# EAGLE design PHMETER_V_1.1.9 (EAGLE 9.6.2)
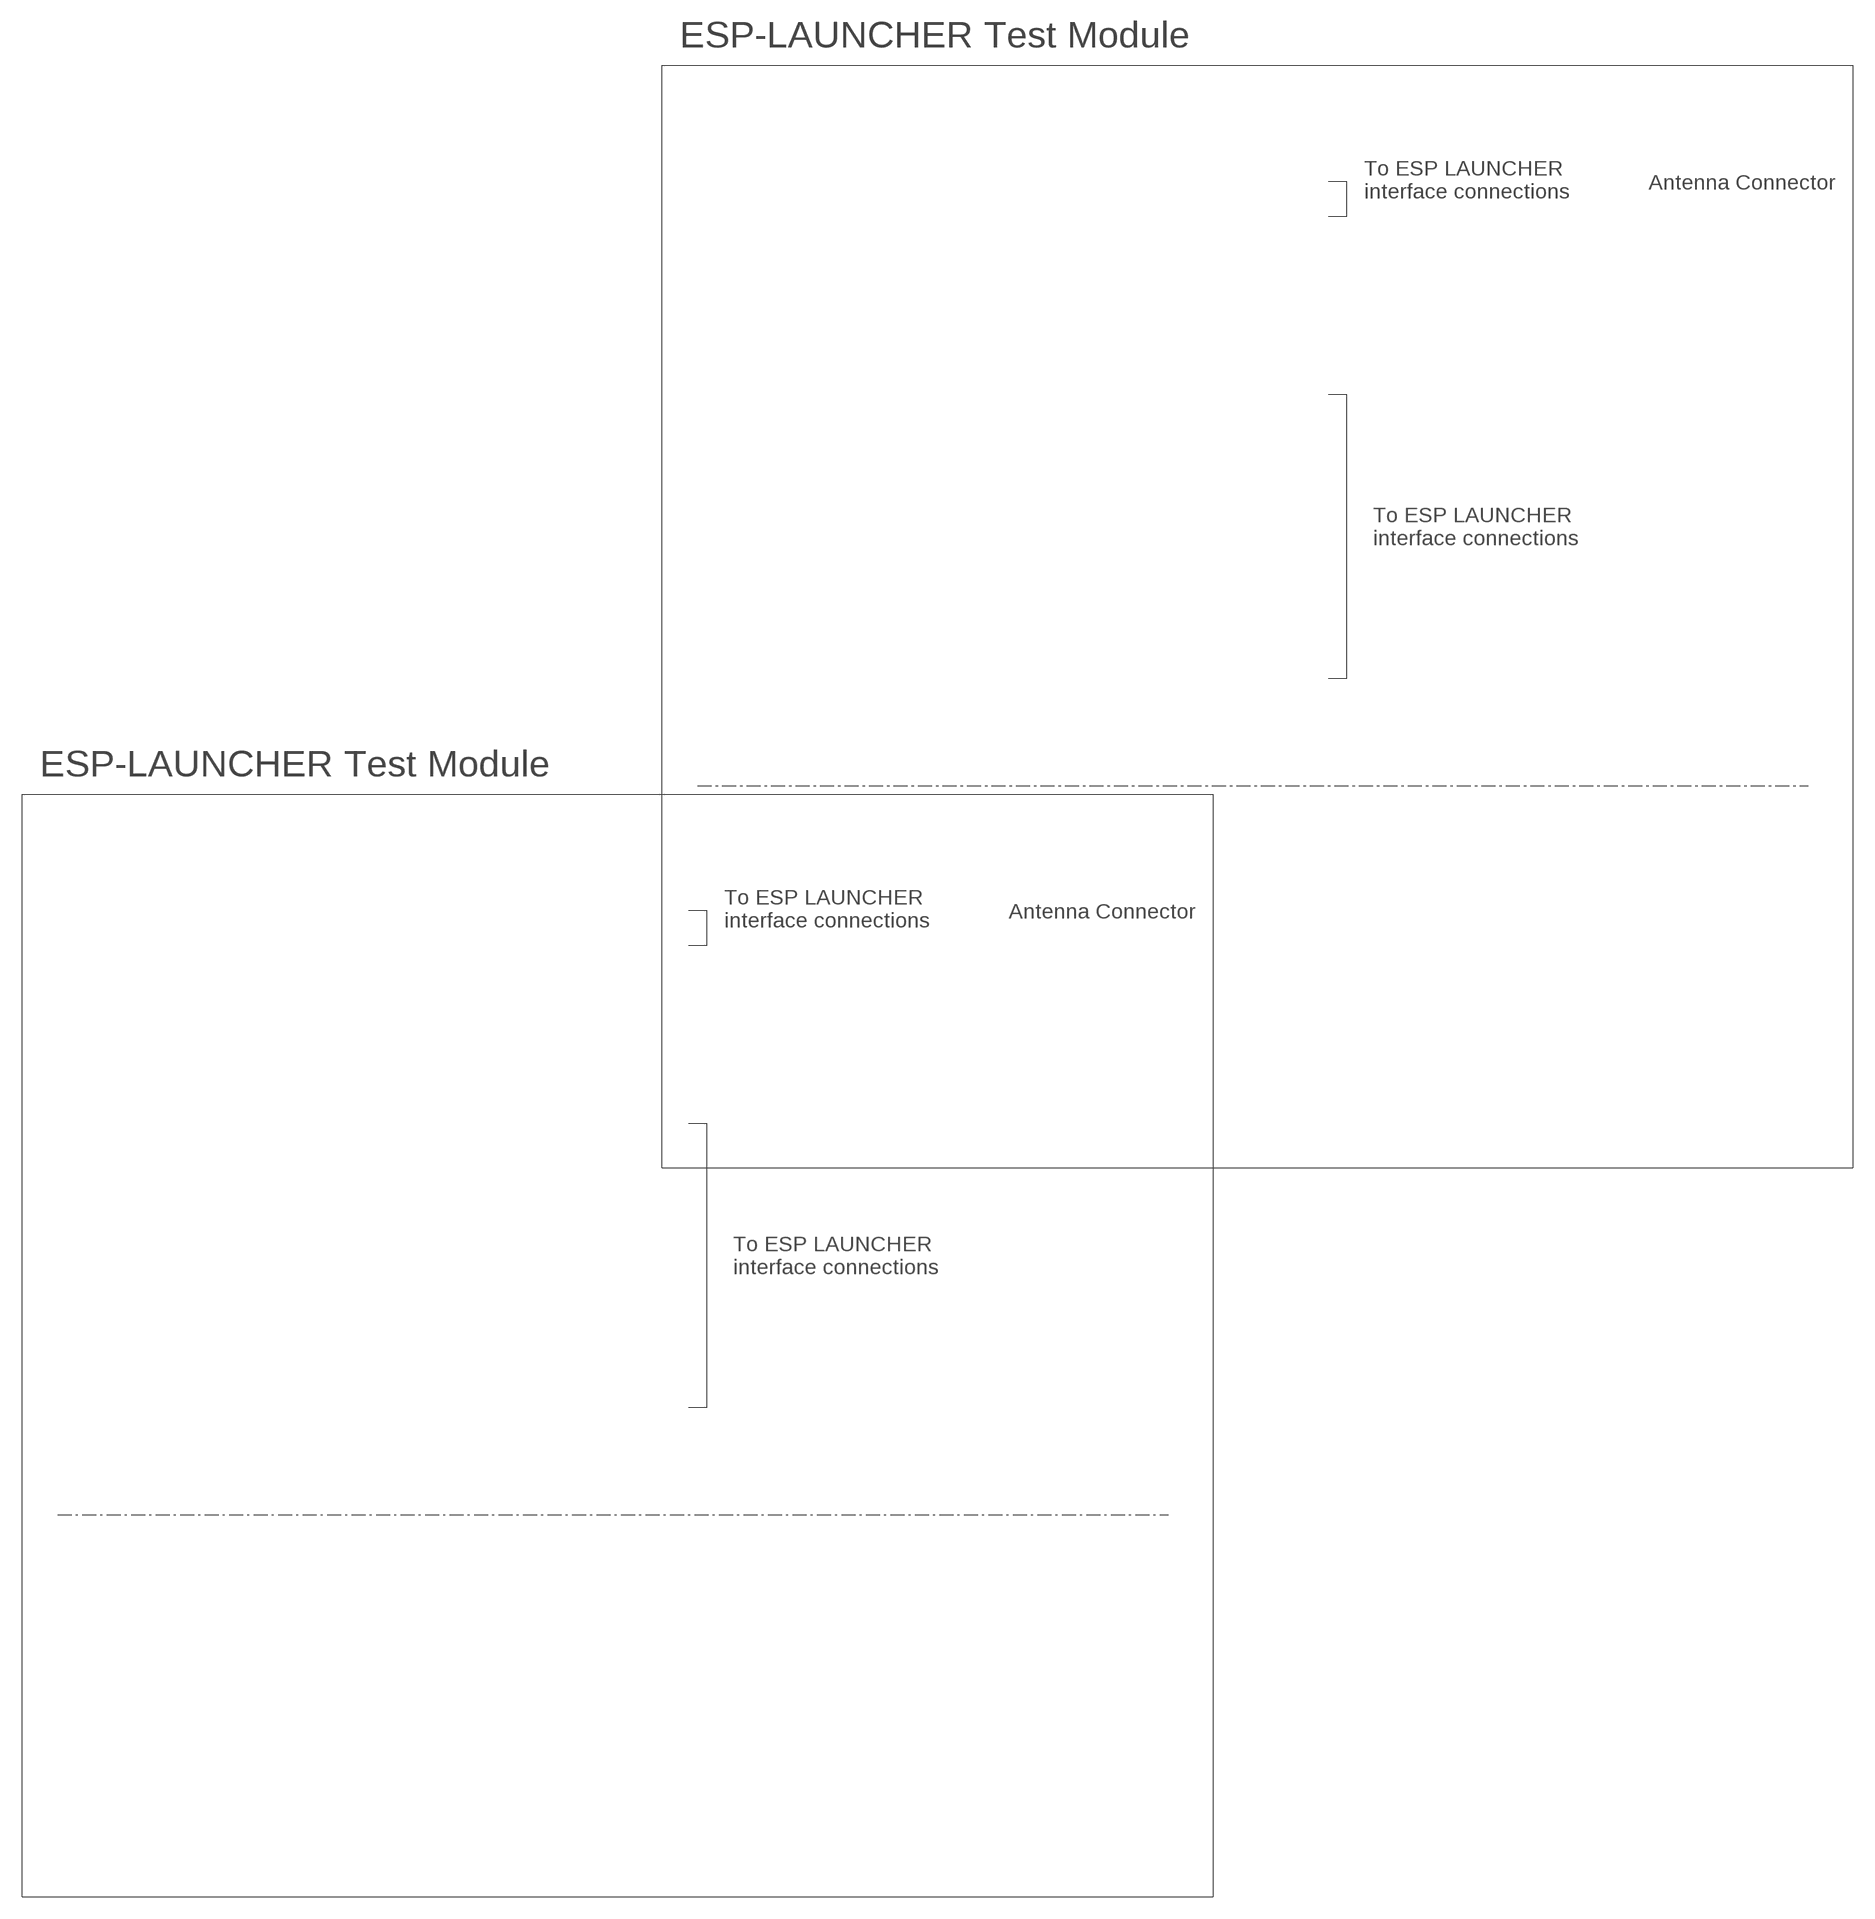
[diagram p0: schematic, sheet 1, part 1 of 3]
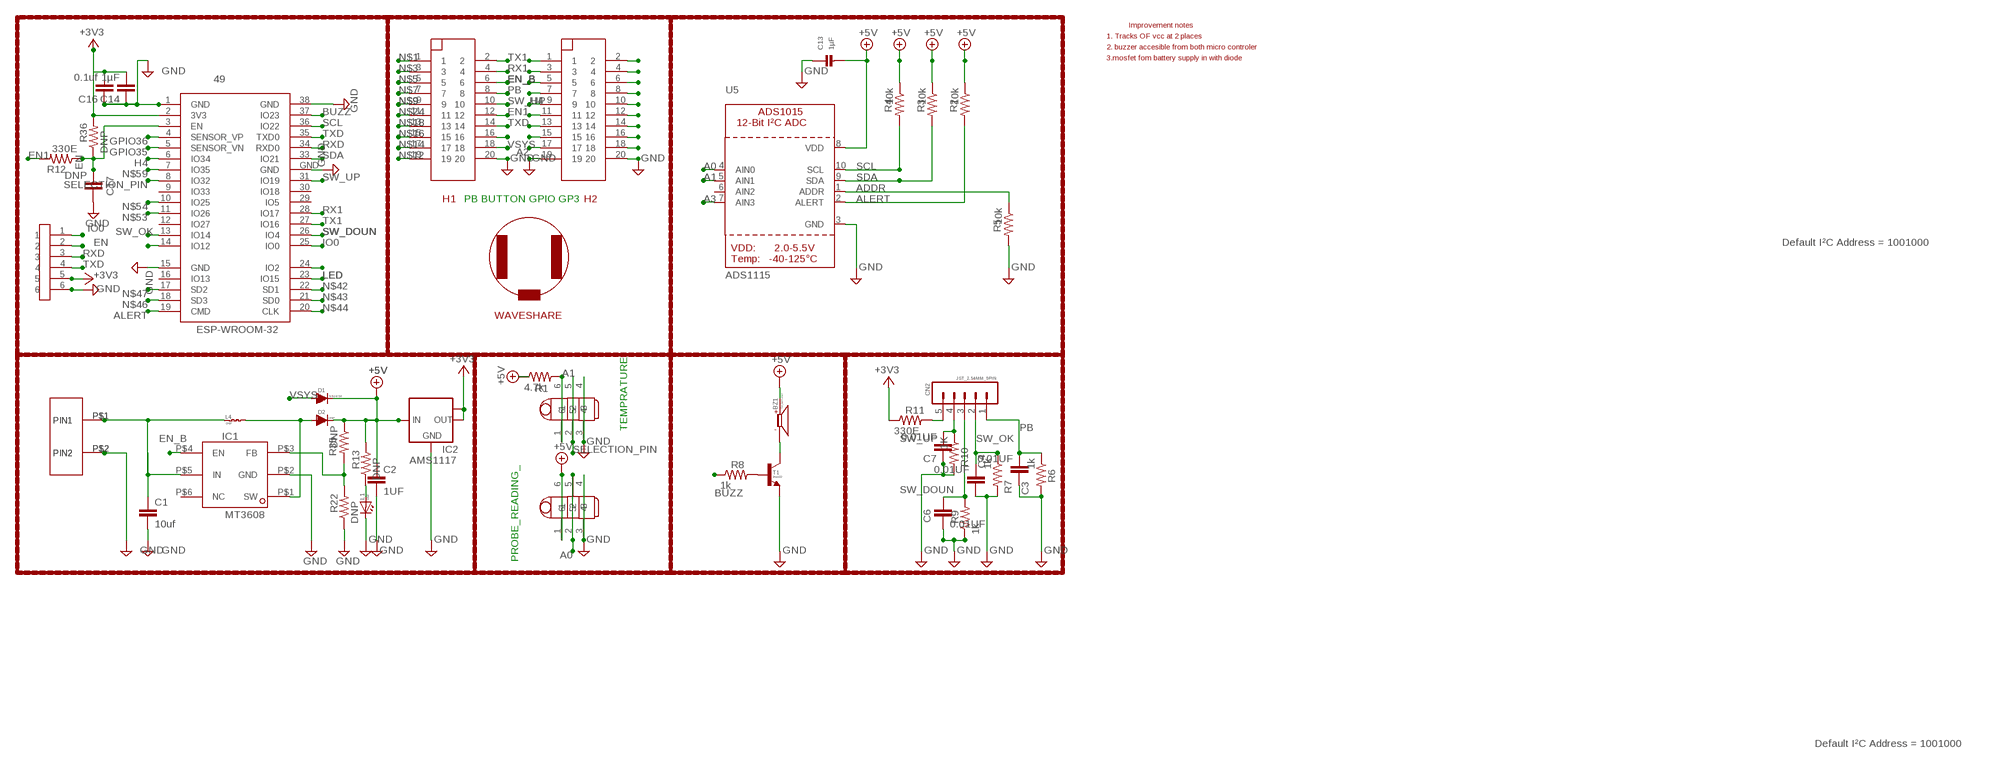
[diagram p1: schematic, sheet 1, part 2 of 3]
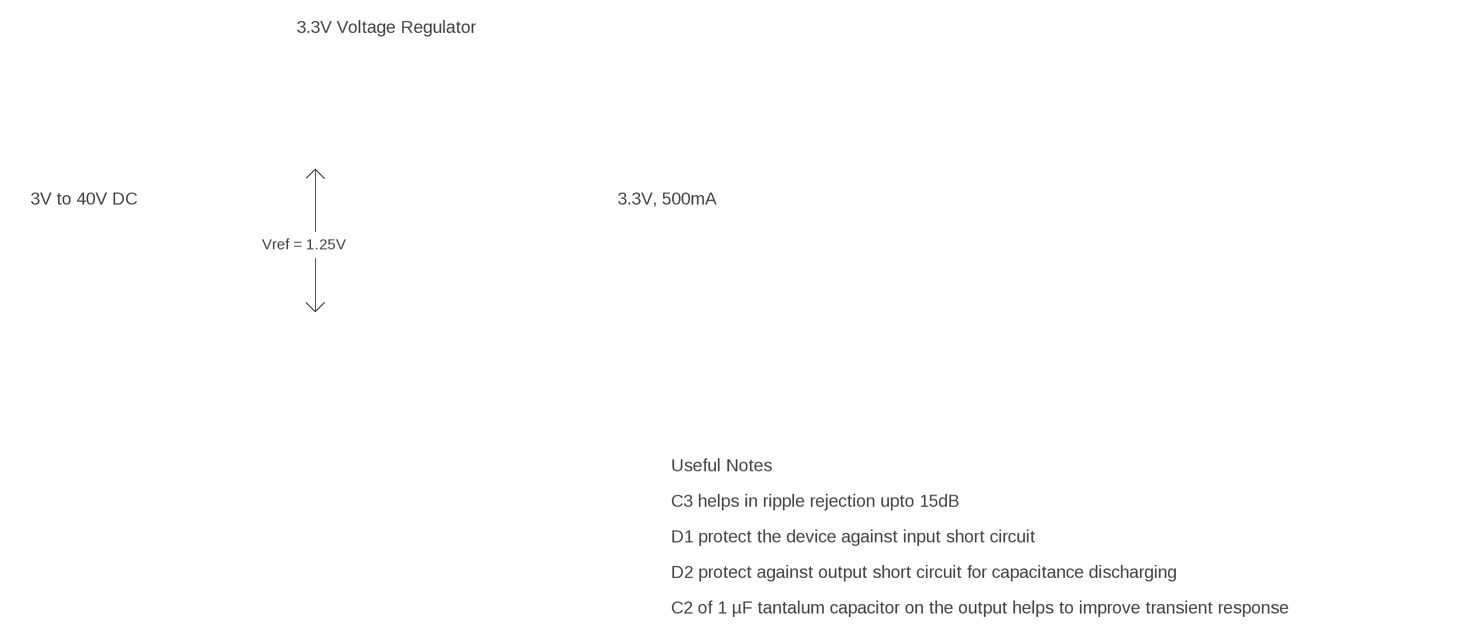
[diagram p2: schematic, sheet 1, part 3 of 3]

## Parts
49  ESP-WROOM-32  [ESP-WROOM-32]
BZ1  5v_buzzer  BUZ  [BUZZ_12MM]
C1  10uf  C-EUC1206K  [C1206K]
C2  1UF  C-EUC1206K  [C1206K]
C3  0.01UF  C-EUC0805K  [C0805K]
C4  0.01UF  C-EUC0805K  [C0805K]
C6  0.01UF  C-EUC0805K  [C0805K]
C7  0.01UF  C-EUC0805K  [C0805K]
C13  1µF  CAP_CERAMIC0805  [0805]
C14  1µF  C-EUC0805K  [C0805K]
C16  0.1uf  C-EUC0805K  [C0805K]
C17  DNP  C-EUC0805K  [C0805K]
CN2  JST_2.54MM_5PIN  JST_5-PIN  [JST_5-PIN]
D1  SS14//34  DIODE  [SMB]
D2  DNP  DIODE  [SMB]
IC1  MT3608SOT23-6  [SOT23-6]
IC2  AMS1117  LM1117MPX-5.0  [SOT223]
L1  DNP  LED  [SMB_L]
L4  DNP  INDUCTOR  [DR-75]
R1  4.7k  R-US_M0805  [M0805]
R2  10k  R-US_M0805  [M0805]
R3  10k  R-US_M0805  [M0805]
R4  10k  R-US_R1206  [R1206]
R5  10k  R-US_M0805  [M0805]
R6  1k  R-US_M0805  [M0805]
R7  1k  R-US_M0805  [M0805]
R8  1k  R-US_M0805  [M0805]
R9  1k  R-US_M0805  [M0805]
R10  1K  R-US_M0805  [M0805]
R11  330E  R-US_M0805  [M0805]
R12  330E  R-US_M0805  [M0805]
R13  DNP  R-US_M0805  [M0805]
R22  DNP  R-US_M0805  [M0805]
R35  DNP  R-US_R1206  [R1206]
R36  DNP  R-US_M0805  [M0805]
T1  2N2222  TRANSISTOR_NPNSOT-23  [SOT-23]
U5  ADS1115  ADC_ADS1015  [MSOP10]
U$2  1.27_6PIN  [1.27_6PIN]
U$3  1.27MM102SMD  [1.27MM10*2SMD]
U$4  1.27MM102SMD  [1.27MM10*2SMD]
U$5  1.27MM2PIN1.27MM  [1.27MM_2PIN]
U$31  AUX_FEMALE_THT  [AUX_FEMALE_THT]
U$32  AUX_FEMALE_THT  [AUX_FEMALE_THT]
U$35  1.27MM2PIN1.27MM  [1.27MM_2PIN]
WAVESHARE1  DISPLAY  WAVESHARE1  [WAVESHARE]

## Nets
+3V3: 49.2(3V3) C14.2 C16.2 IC2.2(OUT) IC2.TAB(OUT1) R11.1 R36.2 U$2.5
+5V: BZ1.+ C2.1 C13.2 D1.K D2.K IC2.3(IN) R1.1 R2.1 R3.1 R4.1 R13.2 R35.1 U5.8(VDD) U$32.1 U$32.6
A0: U5.4(AIN0) U$32.2 U$32.5
A1: R1.2 U5.5(AIN1) U$31.1 U$31.6
A2: U$4.17
A3: U5.7(AIN3)
ADDR: R5.1 U5.1(ADDR)
ALERT: 49.19(CMD) R2.2 U5.2(ALERT)
BUZZ: 49.37(IO23) R8.1
EN: 49.3(EN) C17.2 R12.1 R36.1 U$2.2
EN1: R12.2 U$3.12
EN_B: IC1.P$4(EN) U$3.6
GND: 49.1(GND) 49.15(GND) 49.38(GND) 49.GND C1.2 C2.2 C3.1 C4.1 C6.2 C7.1 C13.1 C14.1 C16.1 C17.1 IC1.P$2(GND) IC2.1(GND) L1.K R5.2 R6.2 R7.2 R9.1 R10.2 R22.1 T1.2(E) U5.3(GND) U$2.6 U$3.20 U$4.19 U$4.20 U$5.P$2(PIN2) U$31.3 U$31.4 U$32.3 U$32.4 U$35.P$2(PIN2)
GPIO35: 49.5(SENSOR_VN)
GPIO36: 49.4(SENSOR_VP)
H4: 49.6(IO34) U$4.9
IO0: 49.25(IO0) U$2.1
LED: 49.23(IO15)
N$1: U$3.1
N$3: U$3.3
N$4: CN2.5 R11.2
N$5: U$3.5
N$6: 49.24(IO2)
N$7: U$3.7
N$8: L1.A R13.1
N$9: U$3.9
N$11: 49.14(IO12)
N$12: U$3.19
N$13: U$4.14
N$14: U$3.17
N$15: U$3.16
N$16: U$3.15
N$18: U$3.13
N$22: IC1.P$3(FB) R22.2 R35.2
N$23: C1.1 IC1.P$5(IN) L4.1 U$5.P$1(PIN1) U$35.P$1(PIN1)
N$24: U$3.11
N$25: U$4.1
N$26: D2.A IC1.P$1(SW) L4.2
N$27: U$4.2
N$28: U$4.3
N$29: U$4.4
N$30: U$4.5
N$35: U$4.6
N$37: R8.2 T1.1(B)
N$38: BZ1.- T1.3(C)
N$39: U$4.7
N$40: U$4.8
N$42: 49.22(SD1)
N$43: 49.21(SD0)
N$44: 49.20(CLK)
N$46: 49.18(SD3)
N$47: 49.17(SD2)
N$53: 49.11(IO26)
N$54: 49.10(IO25)
N$59: 49.7(IO35)
N$60: U$4.10
N$63: U$4.18
N$65: U$4.16
N$66: U$4.15
N$68: U$4.13
N$69: U$4.12
N$70: U$4.11
PB: C3.2 CN2.1 R6.1 U$3.8
RX1: 49.28(IO17) U$3.4
RXD: 49.34(RXD0) U$2.3
SCL: 49.36(IO22) R4.2 U5.10(SCL)
SDA: 49.33(IO21) R3.2 U5.9(SDA)
SELECTION_PIN: 49.8(IO32) U$31.2 U$31.5
SW_DOUN: 49.26(IO4) C6.1 CN2.3 R9.2
SW_OK: 49.13(IO14) C4.2 CN2.2 R7.1
SW_UP: 49.31(IO19) C7.2 CN2.4 R10.1 U$3.10
TX1: 49.27(IO16) U$3.2
TXD: 49.35(TXD0) U$2.4 U$3.14
VSYS: D1.A U$3.18
Unconnected: 49.9(IO33) 49.12(IO27) 49.16(IO13) 49.29(IO5) 49.30(IO18) IC1.P$6(NC) U5.6(AIN2)

## Notes on the sheet
- ESP-LAUNCHER Test Module
- Antenna Connector
- To ESP LAUNCHER
  interface connections
- To ESP LAUNCHER
  interface connections
- ESP-LAUNCHER Test Module
- Antenna Connector
- To ESP LAUNCHER
  interface connections
- To ESP LAUNCHER
  interface connections
- Improvement notes
- 1. Tracks OF vcc at 2 places
- 2. buzzer accesible from both micro controler
- 3.mosfet fom battery supply in with diode
- H1 | PB BUTTON GPIO GP3 | H2
- Default I²C Address = 1001000
- TEMPRATURE
- PROBE_READING_
- Default I²C Address = 1001000
- 3.3V Voltage Regulator
- 3V to 40V DC | 3.3V, 500mA
- Vref = 1.25V
- Useful Notes
- C3 helps in ripple rejection upto 15dB
- D1 protect the device against input short circuit
- D2 protect against output short circuit for capacitance discharging
- C2 of 1 µF tantalum capacitor on the output helps to improve transient response

## Library data of the parts
49 = esp32:ESP-WROOM-32: Espressif Systems ESP-WROOM-32
BZ1 = Squadron:BUZ
C1-C4 C6 C7 C14 C16 C17 = rcl:C-EU: CAPACITOR, European symbol; SPICEPREFIX: C
C13 = microbuilder:CAP_CERAMIC: Ceramic Capacitors 0402 - 0402 Surface Mount Capacitors 16pF 50V 5% [Digikey: 445-4899-2-ND] 18pF 50V 5% [Digikey: 490-1281-2-ND] 22pF 50V 5% [Digikey: 490-1283-2-ND] 68pF 50V 5% [Digikey: 490-1289-2-ND] 0.1uF 10V 10% [Digikey: 490-1318-2-ND] 1.0uF 6.3V 10% [Digikey: 490-1320-2-ND] 0603 - 0603 Surface Mount Capacitors 16 pF 50V 5% [Digikey: 445-5051-2-ND] 22 pF 50V [Digikey: PCC220ACVTR-ND] 33 pF 50V 5% [Digikey: 490-1415-1-ND] 56pF 50V 5% [Digikey: 490-1421-1-ND] 220pF 50V 5% [Digikey: 445-1285-1-ND] 680 pF 50V 2200 pF 50V 5% C0G [Digikey: 445-1297-1-ND] 5600 pF 100V 5% X7R [Digikey: 478-3711-1-ND] 0.1 µF 25V 10% [Digikey: PCC2277TR-ND] 0.22 µF 16V 10% X7R [Digikey: 445-1318-1-ND] 1.0 µF 25V 10% [Digikey: 445-5146-2-ND] 0603 - RF Specific 3pF 250V +/-0.1pF RF [Digikey: 712-1347-1-ND] 18 pF 250V 5% [Digikey: 478-3505-1-ND or 712-1322-1-ND] 56 pF 250V 5% C0G RF [Digikey: 490-4867-1-ND] 68 pF 250V RF [Digikey: 490-4868-1-ND] 0805 - 0805 Surface Mount Capacitors 220 pF 250V 2% RF Ceramic Capacitor [Digikey: 712-1398-1-ND] 1000 pF 50V 2% NP0 Ceramic Capacitor [Digikey: 478-3760-1-ND] 0.1 µF 25V 10% Ceramic Capacitor [Digikey: PCC1828TR-ND] 1.0 µF 16V 10% Ceramic Capacitor[Digikey: 490-1691-2-ND] 10.0 µF 10V 10% Ceramic Capacitor[Digikey: 709-1228-1-ND] 10.0 uF 16V 10% Ceramic Capacitor [Digikey: 478-5165-2-ND] 47 uF 6.3V 20% Ceramic Capacitor [Digikey: 587-1779-1-ND or 399-5506-1-ND] 1206 - 1206 Surface Mount Capacitors 47uF 10V 20% Ceramic Capacitor [Digikey: 490-5528-1-ND or 399-5508-1-ND or 445-6010-1-ND] 100uF 6.3V -20%, +80% Y5V Ceramic Capacitor (Digikey: 490-4512-1-ND, Mouser: 81-GRM31CF50J107ZE1L)
CN2 = Squadron:JST_5-PIN
D1 D2 = Squadron:DIODE
IC1 = MT3608:MT3608: MT3608 High Efficiency 1.2MHz 2A Step Up Converter BY: Rangana Tennakoon
IC2 = lm1117:LM1117MPX-*
L1 = Squadron:LED
L4 = Squadron:INDUCTOR
R1-R13 R22 R35 R36 = rcl:R-US_: RESISTOR, American symbol; SPICEPREFIX: R
T1 = Squadron:TRANSISTOR_NPN
U5 = microbuilder:ADC_ADS1015: ADS1015 - 12-bit 4-Channel I2C ADC with Internal PGA VDD: 2.0-5.5V Sampling Rate: 3.3ksps Gain Settings: 2/3, 1, 2, 4, 8, 16 I2C Address: ADDR low = 1001000x, ADDR high = 1001001x Internal Comparator The ADS1015 includes an internal comparator that can be set to output a high-level on ALERT when the conversion results exceeeds a pre-defined upper level, and will deassert itself when the level falls below a pre-defined lower threshold level. It can also be set to windowed mode where the ALERT pin will be asserted if the data exceeds the upper threshold or falls below the lower threshold.
U$2 = 1.27mm connector:1.27_6PIN
U$3 U$4 = 1.27mm connector:1.27MM10*2SMD
U$5 U$35 = 1.27mm connector:1.27MM2PIN
U$31 U$32 = aux female:AUX_FEMALE_THT
WAVESHARE1 = waveshare:WAVESHARE

## Module WAVESHAREDISPLAY
Ports: 

### Library data of the parts

## Board
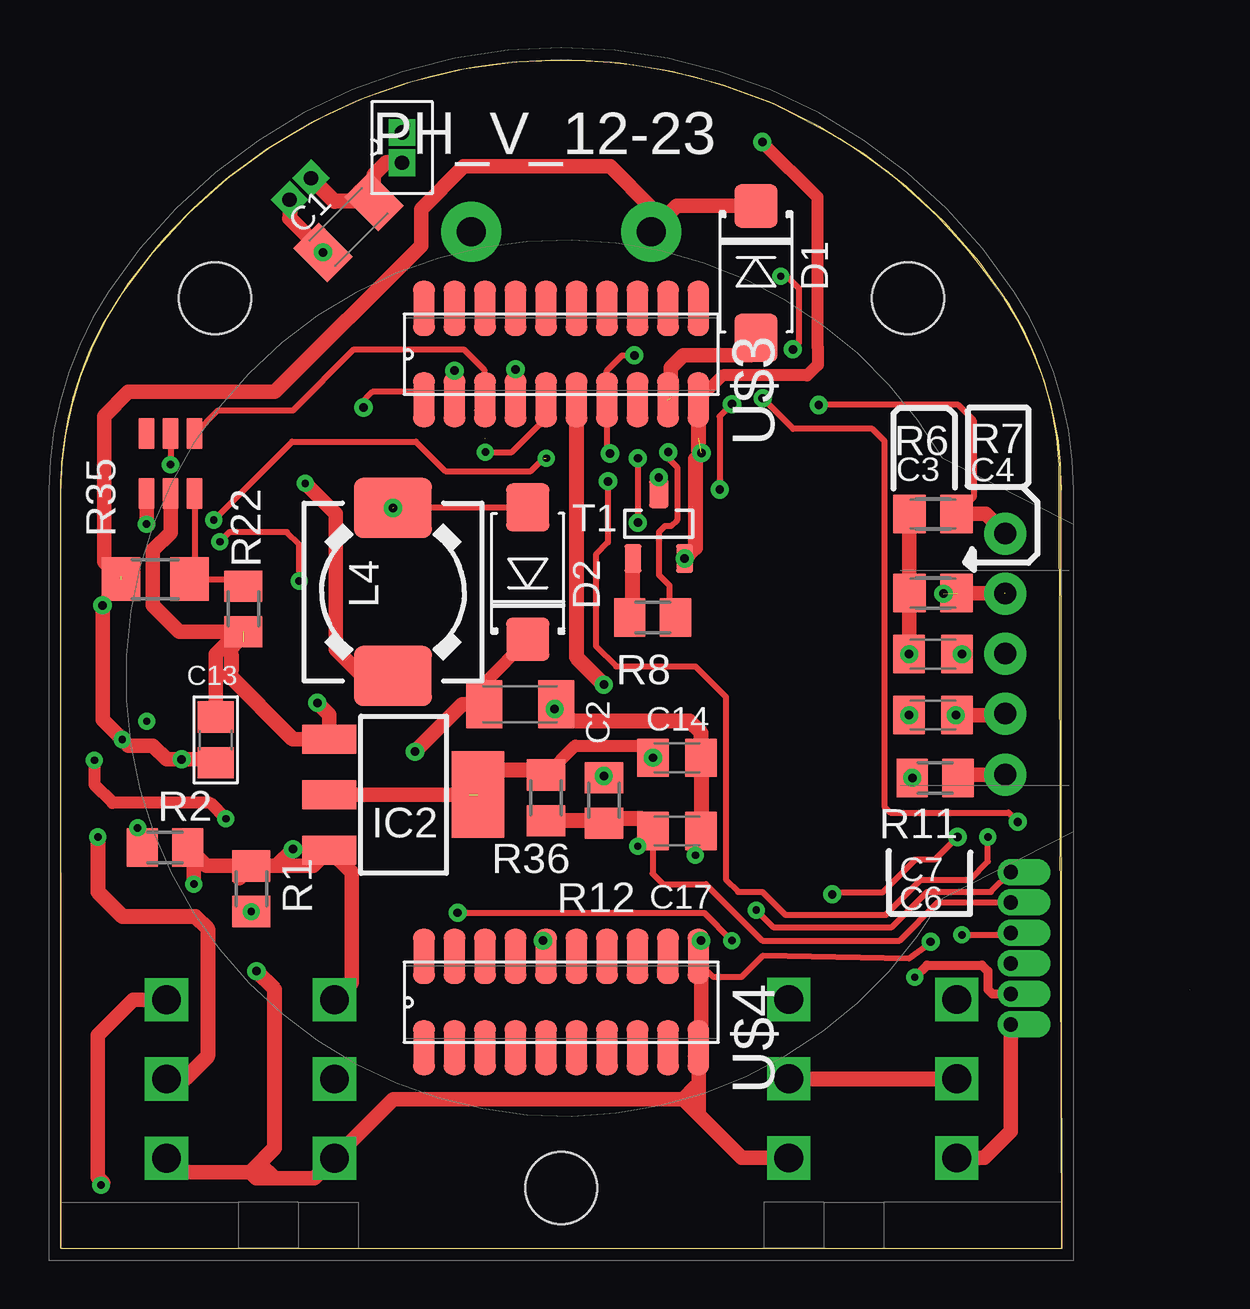
[diagram p3: board, top side]
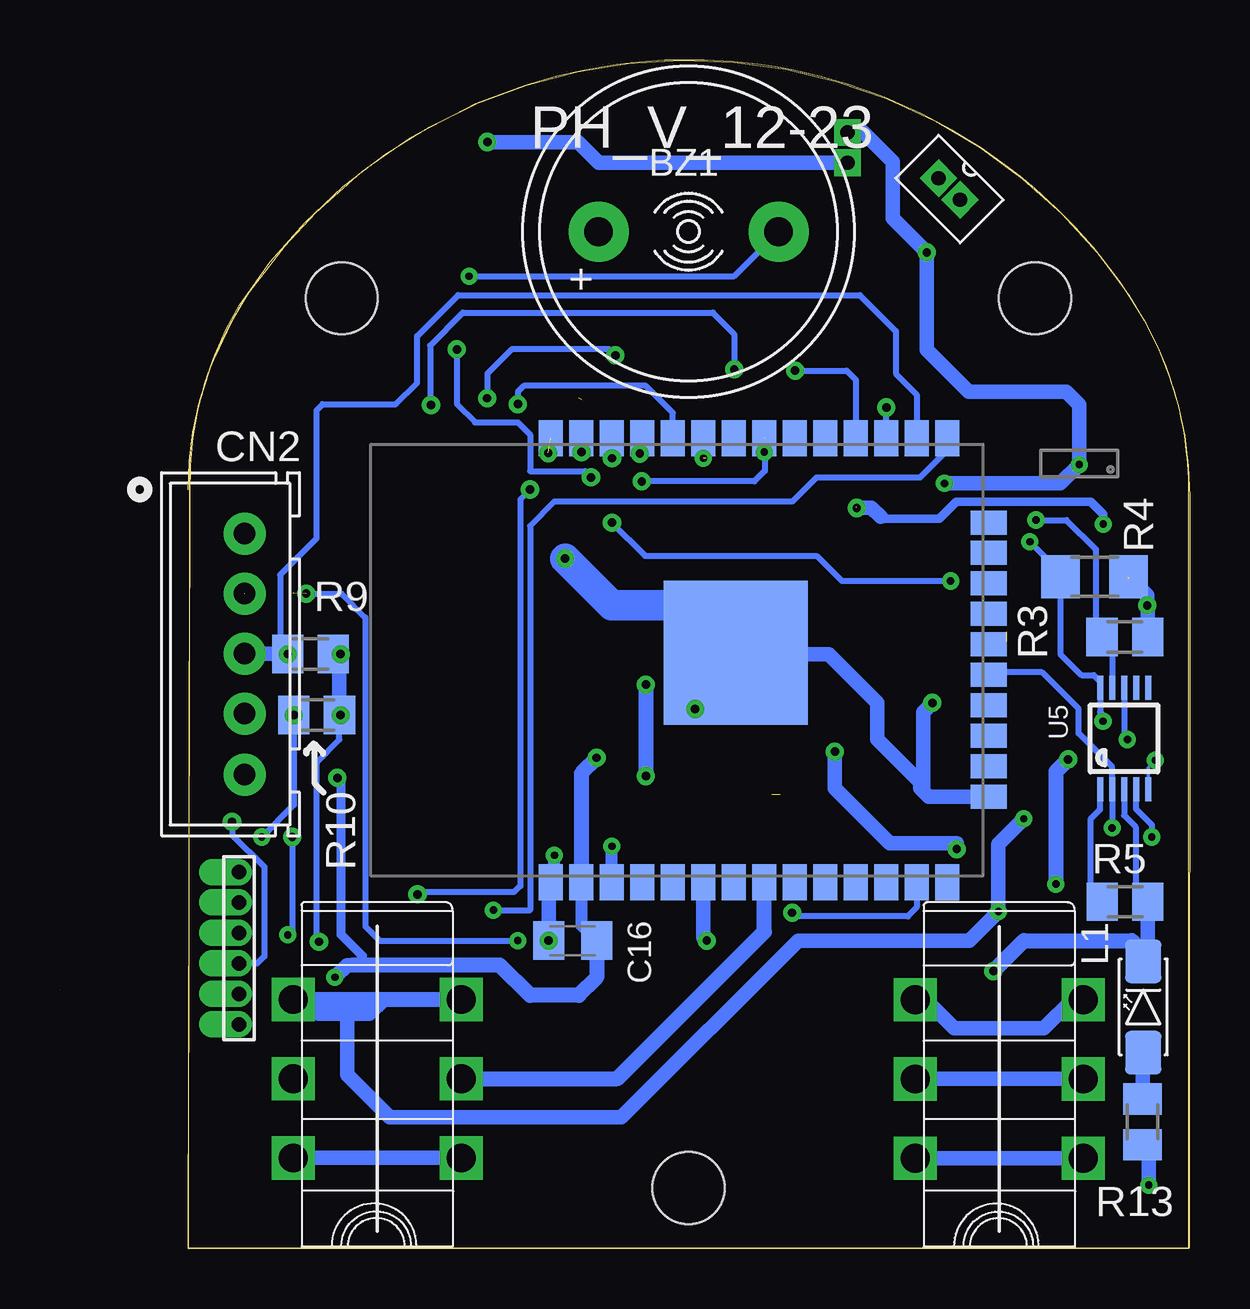
[diagram p4: board, bottom side, seen from below]

Size 47.07 x 49.52 mm. Coordinates in mm from the lower left corner, seen from the top.
Outline: 39.21,39.83 39.64,39.13 39.96,38.56 40.61,37.18
Outline: 41.73,31.61 arc33 39.35,39.58
Outline: 41.73,31.61 arc33 39.35,39.58
Outline: 41.73,31.61 arc33 39.35,39.58
Outline: 41.73,31.61 arc33 39.35,39.58
Outline: 41.73,0 41.64,31.45 arc33 39.58,39.33 arc113 2.54,39.75 arc33 0,31.33 0.03,0.01 41.73,0
Outline: 47.07,10.78 47.07,10.78
Copper layers (1*16): Top 0.035mm / dielectric 1.5mm / Bottom 0.035mm
Design rules "default": minimum track width 6mil, minimum drill 0.35mm, track to track 6mil, track to pad 6mil, pad to pad 6mil, via to via 6mil, smd to smd 6mil, copper to edge 40mil, drill to drill 6mil, minimum pad ring 10mil, minimum via ring 8mil, stop-mask expansion 4mil, vias tented up to drill 0mil, thermal gap 10mil
Holes 3 mm at 20.89,2.52 6.46,39.6 35.34,39.6
tRestrict: area 17.9,-0.5 to 23.8,5.4; area 3.4,36.7 to 9.5,42.8; area 32.3,36.4 to 38.5,42.6
bRestrict: area 17.8,-0.6 to 23.9,5.5; area 3.4,36.8 to 9.4,42.7; area 32.3,36.4 to 38.5,42.6; area 17.8,-0.6 to 23.9,5.5

### Footprints (pad centres in the part's own frame; a part is rotated, then mirrored left to right if it is on the bottom)
ESP-WROOM-32 = smd 1.5 x 1: 1 -9.25,7; 2 -9.25,5.73; 3 -9.25,4.46; 4 -9.25,3.19; 5 -9.25,1.92; 6 -9.25,0.65; 7 -9.25,-0.62; 8 -9.25,-1.89; 9 -9.25,-3.16; 10 -9.25,-4.43; 11 -9.25,-5.7; 12 -9.25,-6.97; 13 -9.25,-8.24; 14 -9.25,-9.51; 25 9.25,-9.51; 26 9.25,-8.24; 27 9.25,-6.97; 28 9.25,-5.7; 29 9.25,-4.43; 30 9.25,-3.16; 31 9.25,-1.89; 32 9.25,-0.62; 33 9.25,0.65; 34 9.25,1.92; 35 9.25,3.19; 36 9.25,4.46; 37 9.25,5.73; 38 9.25,7 | smd 1 x 1.5: 15 -5.7,-11.25; 16 -4.43,-11.25; 17 -3.16,-11.25; 18 -1.89,-11.25; 19 -0.62,-11.25; 20 0.65,-11.25; 21 1.92,-11.25; 22 3.19,-11.25; 23 4.46,-11.25; 24 5.73,-11.25 | smd 6 x 6: GND 0.3,-0.7
BUZZ_12MM = drill 1.2 pad 2.5: + -3.75,0; - 3.75,0
C1206K = smd 1.5 x 2: 1 -1.5,0; 2 1.5,0
C0805K = smd 1.3 x 1.6: 1 -1,0; 2 1,0
0805 = smd 1.3 x 1.5: 1 -0.95,0; 2 0.95,0
JST_5-PIN = drill 0.9 pad 1.75: 1 5.02,0; 2 2.52,0; 3 0.02,0; 4 -2.48,0; 5 -5.02,0
SMB = smd 2 x 1.8: A 2.75,0 | smd 1.8 x 1.8: K -2.75,0
SOT23-6 = smd 1.27 x 0.635: P$1 -1.27,1.27; P$2 -1.27,0.27; P$3 -1.27,-0.73; P$4 1.23,-0.73; P$5 1.23,0.27; P$6 1.23,1.27
SOT223 = smd 1.219 x 2.235: 1 -2.311,-3.099; 2 0,-3.099; 3 2.311,-3.099 | smd 3.6 x 2.2: TAB 0,3.099
SMB_L = smd 1.5 x 1.8: A 0,1.9; K 0,-1.9
DR-75 = smd 2.5 x 3.25: 1 -3.5,0; 2 3.5,0
M0805 = smd 1.3 x 1.6: 1 -0.95,0; 2 0.95,0
R1206 = smd 1.6 x 1.803: 1 -1.422,0; 2 1.422,0
SOT-23 = smd 0.7 x 1.2: 1 -1.077,-1.35; 2 1.077,-1.35 | smd 0.8 x 1.2: 3 0,1.35
MSOP10 = smd 0.25 x 1: 1 -1,-2.113; 2 -0.5,-2.113; 3 0,-2.113; 4 0.5,-2.113; 5 1,-2.113; 6 1,2.113; 7 0.5,2.113; 8 0,2.113; 9 -0.5,2.113; 10 -1,2.113
1.27_6PIN = drill 0.6 pad 1 offset: 1 -3.175,0; 2 -1.905,0; 3 -0.635,0; 4 0.635,0; 5 1.905,0; 6 3.175,0
1.27MM10*2SMD = smd 0.9 x 2.28: 1 -5.715,1.905; 2 -5.715,-1.905; 3 -4.445,1.905; 4 -4.445,-1.905; 5 -3.175,1.905; 6 -3.175,-1.905; 7 -1.905,1.905; 8 -1.905,-1.905; 9 -0.635,1.905; 10 -0.635,-1.905; 11 0.635,1.905; 12 0.635,-1.905; 13 1.905,1.905; 14 1.905,-1.905; 15 3.175,1.905; 16 3.175,-1.905; 17 4.445,1.905; 18 4.445,-1.905; 19 5.715,1.905; 20 5.715,-1.905
1.27MM_2PIN = drill 0.6 pad 0.813 square: P$1 0,0.635; P$2 0,-0.635
AUX_FEMALE_THT = drill 1.2 square: 1 -3.3,-3.5; 2 0,-3.5; 3 3.3,-3.5; 4 3.3,3.5; 5 0,3.5; 6 -3.3,3.5

### Placement (x,y rotation side)
49  19.62,24.52 90 bottom
BZ1  20.89,42.37 0 bottom
C1  12.02,42.57 45 top
C2  19.17,22.68 0 top
C3  36.38,30.61 0 top
C4  36.38,27.31 0 top
C6  36.38,24.77 180 top
C7  36.38,22.23 0 top
C13  6.49,21.19 270 top
C14  25.71,20.45 180 top
C16  25.71,12.83 0 bottom
C17  25.71,17.4 180 top
CN2  39.39,24.77 90 bottom
D1  29,40.69 270 top
D2  19.49,28.13 90 top
IC1  4.88,32.73 90 top
IC2  14.32,18.91 270 top
L1  1.93,10.06 180 bottom
L4  13.87,27.36 90 top
R1  7.97,14.99 270 top
R2  4.37,16.71 180 top
R3  2.71,25.48 180 bottom
R4  3.97,27.99 180 bottom
R5  2.69,14.45 0 bottom
R6  36.38,30.61 180 top
R7  36.38,27.31 180 top
R8  24.7,26.29 180 top
R9  36.63,24.77 180 bottom
R10  36.38,22.23 0 bottom
R11  36.47,19.61 0 top
R12  22.66,18.67 90 top
R13  1.96,5.28 270 bottom
R22  7.64,26.65 90 top
R35  3.97,27.9 0 top
R36  20.25,18.78 90 top
T1  24.95,30.1 0 top
U5  2.74,21.26 0 bottom
U$2  39.62,12.51 270 bottom
U$3  20.89,37.27 0 top
U$4  20.89,10.27 0 top
U$5  14.26,45.87 0 top
U$31  33.86,7.07 270 bottom
U$32  7.94,7.07 270 bottom
U$35  10.01,44.15 225 bottom
WAVESHARE1  20.89,24.77 0 top

### Tracks (layer width: path | path; a pad name or v marks a point on that pad's centre or on a via)
+3V3  (via drill 0.3 pad 0.61, 0.35, 0.35 pad 0.64)  (1 unrouted)
  Top 0.152: 20.12,19.94 R36.2
  Top 0.381: v35.62,11.3 36.13,11.81 38.41,11.81 38.67,11.56 38.67,10.8 38.85,10.61 U$2.5
  Top 0.508: R36.2 21.48,20.96 24.2,20.96 C14.2
  Top 0.61: IC2.2 17,18.91
  Top 0.635: 16.55,18.91 17,18.91 IC2.TAB | 17.06,18.91 18.09,19.94 20.04,19.94 R36.2
  Bottom 0.152: 24.95,12.07 24.95,12.83 C16.2
  Bottom 0.254: 34.86,11.81 34.47,12.19
  Bottom 0.381: 34.47,12.19 35.36,13.08 35.36,19.46 R11.1
  Bottom 0.508: 49.2 25.35,13.46 C16.2
  Bottom 0.61: v35.62,11.3 35.11,11.81 34.86,11.81
  Bottom 0.635: C16.2 24.71,11.29 25.46,10.54 27.49,10.54 28.76,11.81 34.86,11.81 | 49.2 25.35,19.8 24.7,20.45 C14.2
  other vias: 24.71,20.45 35.52,19.61
+5V  (via drill 0.3 pad 0.61, 0.35, 0.35 pad 0.64)  (1 unrouted)
  Top 0.152: 29.01,43.56 D1.K 28.96,43.36
  Top 0.254: 10.85,16.96 IC2.3 | C2.1 17.47,22.88 17.47,23.36 | 28.94,43.38 D1.K | v5.07,20.38 5.65,20.38 6.35,20.38 C13.2
  Top 0.483: 11.11,16.71 IC2.3
  Top 0.508: R35.1 2.04,28.4 | C2.1 17.67,23.56 D2.K
  Top 0.61: 5.65,20.38 4.44,20.38 3.87,20.96 2.85,20.96 v2.6,21.21 1.77,22.04 v1.77,26.8 | R1.1 9.01,15.94 | 9.01,15.94 10.56,15.94 IC2.3 12.15,15.67 12.15,11.08 U$32.1 | v9.71,16.64 9.01,15.94 | R1.1 7.46,15.43 | 2.09,28.35 R35.1 1.84,28.61 1.84,34.67 2.85,35.69 8.95,35.69 15.04,41.78 15.04,43.31 16.82,45.09 22.92,45.09 24.64,43.37 BZ1.+ 25.71,43.44 D1.K | C2.1 16.76,22.68 v14.79,20.7 | R1.1 6.09,15.94 R2.1 5.58,16.46 v5.58,15.19 | U$32.6 3.06,10.37 1.58,8.89 1.58,2.97 1.81,2.74 v1.71,2.64
  Bottom 0.254: 2.6,28.04 R4.1 | U5.8 2.74,21.35 v2.6,21.21
  Bottom 0.61: v9.71,16.64 9.71,16.89 12.5,16.89 14.79,19.18 v14.79,20.7 | R4.1 1.77,27.21 v1.77,26.8 1.76,26.78 R3.1 | U$32.1 11.01,10.37 9.81,9.17 6.08,9.17 4.88,10.37 U$32.6 | v1.71,2.64 1.71,4.07 R13.2
  Bottom 0.635: v5.07,20.38 5.58,19.87 v5.58,15.19
A0  (via drill 0.3 pad 0.61)
  Top 0.635: v1.58,17.15 1.58,14.86 2.6,13.84 5.65,13.84 6.15,13.34 6.15,8 5.22,7.07 U$32.5
  Bottom 0.254: U5.4 2.24,18.31 1.58,17.65 v1.58,17.15
  Bottom 0.61: U$32.5 U$32.2
A1  (via drill 0.3 pad 0.61)
  Top 0.508: v1.43,20.34 1.43,19.33 2.19,18.56 6.26,18.56 v6.92,17.91
  Bottom 0.152: U5.5 1.74,20.04 v1.43,20.34
  Bottom 0.254: 7.74,14.04 R1.2
  Bottom 0.61: v6.92,17.91 7.97,16.85 R1.2 9.18,12.83 16.31,12.83 23.68,5.46 33.33,5.46 35.11,7.24 35.11,9.78 | 35.11,9.78 35.11,10.37 | 35.11,9.78 36.29,9.78 36.89,10.37 | 35.11,9.78 34.18,9.78 33.59,10.37
  Bottom 0.635: U$31.6 33.59,10.37 35.11,10.37 36.89,10.37 U$31.1
  other vias: 7.97,14.04
A2
  Top 0.152: 24.95,11.3 24.95,11.81 25.2,12.07 U$4.17
ADDR
  Bottom 0.254: R5.1 4.12,14.93 4.12,17.91 3.74,18.29 U5.1
ALERT  (via drill 0.3 pad 0.61)
  Top 0.254: v3.24,17.52 3.49,17.27 3.49,16.78 R2.2
  Bottom 0.254: v3.24,17.52 U5.2 3.24,20.07 4.63,21.46 4.63,22.48 6.15,24 8.26,24 49.19
BUZZ  (via drill 0.35)
  Top 0.254: v25.35,33.18 25.35,32.93 25.71,32.56 25.71,30.35 25.46,30.1 25.2,30.1 24.95,29.85 24.95,28.07 25.39,27.63 25.39,26.54
  Top 0.508: 25.39,26.54 R8.1
  Bottom 0.152: v25.35,33.18 25.2,33.32 25.2,34.42
  Bottom 0.254: 49.37 v25.35,33.18
EN  (via drill 0.3 pad 0.61)
  Top 0.152: 20.38,17.91 R36.1 | 22.66,17.91 R12.1 22.98,17.4
  Top 0.254: C17.2 25.22,16.89 24.7,16.89 24.7,15.62 25.14,15.18 26.92,15.18 29.27,12.83 34.98,12.83 36.57,14.42 U$2.2
  Top 0.61: C17.2 v24.08,16.76
  Top 0.635: C17.2 24.2,17.91 22.66,17.91 | R12.1 22.56,17.83 R36.1
  Bottom 0.508: 49.3 v24.08,16.76
EN1  (via drill 0.35)
  Top 0.152: 22.66,19.94 v22.66,19.69 R12.2 | 21.39,34.93 21.65,35.18 U$3.12
  Top 0.635: U$3.12 21.52,24.64 v22.66,23.5
  Bottom 0.635: v22.66,23.5 v22.66,19.69
EN_B
  Top 0.152: 17.33,34.93 17.58,35.18 17.67,35.3 U$3.6
  Top 0.254: IC1.P$4 6.58,34.93 9.71,34.93 12.25,37.47 16.82,37.47 17.67,36.62 17.67,35.3
GND  (via drill 0.3 pad 0.61, 0.35, 0.35 pad 0.64)  (2 unrouted)
  Top 0.152: 13.14,43.69 C1.2 | 26.73,35.18 U$3.20 | 26.62,8.39 26.73,8.51 | U$4.19 26.73,12.07 26.62,12.17 U$4.19 | 26.22,8 26.47,8.26 U$4.20 | U$4.19 26.6,12.83 C16.1
  Top 0.254: 7.13,24.77 7.64,25.27 | 7.13,24.04 7,23.92 | 20.72,22.73 C2.2 | 26.6,33.28 v26.73,33.15 | C4.1 R7.2 | R6.2 C3.1 | v36.28,12.78 36.12,12.62 35.37,12.08 29.27,12.19 28.39,11.3 27.24,11.3 26.73,11.81
  Top 0.508: v29.27,46.1 31.55,43.82 31.55,37.56 31.58,37.54 31.58,36.82 31.13,36.38 27.62,36.38 U$3.20 | C1.2 11.93,43.63 | C2.2 20.61,22.62 v20.61,22.48 | 26.73,12.04 U$4.19 | v26.47,16.38 26.46,16.4 26.46,17.15 C17.1
  Top 0.61: U$31.4 28.42,3.77 26.62,5.57 | 26.62,6.73 26.62,8.39 U$4.20 | 26.62,5.57 26.62,6.73 | U$32.3 13.9,6.22 25.97,6.22 | 26.62,5.57 25.97,6.22 | 25.97,6.22 26.47,6.73 26.62,6.73 | C3.1 C4.1 C6.2 | 11.36,3.68 U$32.3 | 9.7,21.22 IC2.1 11.22,22.24 v10.73,22.73 | IC1.P$2 4.61,29.82 3.87,29.08 3.87,26.8 4.97,25.7 7.42,25.7 | 7.42,25.7 R22.1 | C13.1 6.49,24.77 7.42,25.7 | 26.73,8.51 26.73,11.81 26.73,12.04 U$4.19 | 26.6,33.02 26.47,32.89 | U$2.6 39.62,4.89 38.5,3.77 U$31.3 | C1.2 13.08,44.75 13.6,45.26 14.23,45.26 U$5.P$2 | U$32.4 5.03,3.18 7.93,3.18 | 8.31,3.56 7.93,3.18 | 8.31,3.56 8.52,3.77 | U$32.3 10.59,2.92 8.95,2.92 | 8.95,2.92 8.31,3.56 | 7.93,3.18 8.19,2.92 8.95,2.92
  Top 0.635: 8.52,3.77 8.95,4.19 8.95,10.8 v8.19,11.56 | 7.13,24.77 7.13,24.04 | 9.7,21.22 7,23.92 | 26.6,35.84 U$3.20 26.6,33.28 | C17.1 C14.1 26.71,21.48 26.22,21.97 21.37,21.97 C2.2 | T1.2 26.47,29.2 26.47,32.89 v26.73,33.15 | U$35.P$2 11.43,43.63 C1.2 12.95,43.63 12.5,44.07
  Bottom 0.152: 26.73,33.91 49.38 | 2.74,18.55 U5.3
  Bottom 0.254: U5.3 2.74,18.05 2.25,17.56 2.25,14.96 R5.2 | v36.28,12.78 36.38,12.88 36.38,20.26 35.43,21.21 R10.2 C7.1
  Bottom 0.508: v20.61,22.48 20.38,22.71 20.38,22.73 | 49.GND 20.61,23.13 v20.61,22.48 | 20.89,26.54 20.61,26.27 20.61,24 v20.61,22.48 | 49.1 26.47,15.41 v26.47,16.38
  Bottom 0.61: L1.K 1.74,12.15 R5.2 | 35.38,24.82 R9.1 | 49.15 10.88,18.82 11.11,19.05 | 11.11,19.05 11.23,19.18 11.23,19.43 13.01,21.21 13.01,22.73 15.04,24.77 18.6,24.77 19.85,24.77 20.61,24 | v10.73,22.73 11.11,22.35 11.11,19.05 | 49.1 26.71,15.17 C16.1 | C6.2 35.38,24.82 | R10.2 35.43,24.77 35.38,24.82 | U$5.P$2 24.62,45.24 25.48,46.1 v29.27,46.1 | U$32.4 U$32.3 | U$31.4 U$31.3
  Bottom 0.635: v8.19,11.56 6.92,12.83 2.42,12.83 1.74,12.15
  Bottom 1.27: T1.2 24.07,26.8 20.63,26.8 18.6,24.77
  other vias: 26.03,28.75 35.38,22.23 35.38,24.77 26.71,12.83
H4  (via drill 0.35)
  Top 0.61: v20.12,12.83 20.38,12.83 20.38,12.3 U$4.9
  Bottom 0.61: 49.6 20.27,12.97 v20.12,12.83
IO0  (via drill 0.3 pad 0.61)
  Top 0.254: v29.01,14.1 29.72,13.4 34.66,13.4 36.13,14.86 38.79,14.86 U$2.1
  Bottom 0.254: v29.01,14.1 27.49,14.1 27.49,30.1 26.47,31.12 16.57,31.12 15.55,32.13 11.23,32.13 10.11,33.26 49.25
N$4
  Top 0.61: R11.2 37.55,19.75 CN2.5
N$8
  Bottom 0.61: R13.1 1.96,8.14 L1.A
N$22
  Top 0.254: 5.56,27.73 R35.2 7.34,27.9 R22.2 | 5.69,27.6 5.56,27.73 | IC1.P$3 5.61,27.77 5.56,27.73
N$23  (via drill 0.3 pad 0.61, 0.35)
  Top 0.152: L4.1 13.77,24
  Top 0.254: IC1.P$5 v4.61,32.66 | 10.96,42.41 10.96,41.53 C1.1
  Top 0.61: L4.1 12.6,23.86 11.49,24.97 11.49,30.61 v10.22,31.88
  Top 0.635: U$35.P$1 9.57,42.92 10.96,41.53
  Bottom 0.61: v10.22,31.88 5.39,31.88 v4.61,32.66 4.61,35.16 5.14,35.69 9.2,35.69 10.96,37.44 C1.1 12.38,42.93 12.38,45.29 13.6,46.51 U$5.P$1
  other vias: 10.96,41.51
N$26  (via drill 0.3 pad 0.61, 0.35 pad 0.64)  (1 unrouted)
  Top 0.254: 13.9,30.88 D2.A
  Top 0.61: IC1.P$1 v3.61,30.19
  Bottom 0.356: 12.88,30.48 12.81,30.41 10.43,30.41 9.72,31.12 4.12,31.12 3.61,30.6 v3.61,30.19
  Bottom 0.61: 12.88,30.48 13.27,30.86 L4.2
  other vias: 13.87,30.86
N$37
  Top 0.635: R8.2 23.87,26.42 T1.1
N$38  (via drill 0.3 pad 0.61, 0.35, 0.35 pad 0.64)
  Top 0.254: T1.3 v24.95,32.13 | v30.54,37.47 30.79,37.72 30.79,40.01 30.28,40.51 v30.03,40.51
  Bottom 0.254: BZ1.- 18.99,40.51 v30.03,40.51 | v30.54,37.47 30.54,35.18 29.78,34.42 28,34.42 27.49,33.91 27.49,32.39 25.2,32.39 v24.95,32.13
PB  (via drill 0.35)
  Top 0.152: 18.85,34.67 18.85,35.23 U$3.8
  Top 0.254: v31.61,35.15 37.43,35.15 38.07,34.51 38.07,31.3 C3.2 R6.1 | v18.98,36.63 U$3.8
  Top 0.61: C3.2 38.56,30.61 CN2.1
  Bottom 0.254: v31.61,35.15 31.65,35.18 31.65,37.63 30.28,38.99 19.87,38.99 18.98,38.1 v18.98,36.63
RX1  (via drill 0.35)
  Top 0.254: U$3.4 v16.44,36.58
  Bottom 0.254: v16.44,36.58 14.3,36.58 13.92,36.2 49.28
RXD  (via drill 0.3 pad 0.61, 0.35, 0.35 pad 0.64)
  Top 0.254: v28,35.18 27.49,34.67 v27.49,31.62 | v32.18,14.76 32.25,14.83 34.25,14.83 35.63,16.2 36.45,16.2 v37.4,17.15 | v37.58,13.07 39.54,13.07 U$2.3
  Bottom 0.152: 21.39,33.66 49.34
  Bottom 0.254: v37.4,17.15 37.4,13.25 v37.58,13.07 | v27.49,31.62 27.9,31.22 27.9,15.11 28.15,14.86 32.07,14.86 v32.18,14.76 | 49.34 21.54,34.81 22.66,35.94 27.74,35.94 28,35.69 v28,35.18
SCL  (via drill 0.3 pad 0.61, 0.35)
  Top 0.254: v9.96,27.81 9.96,29.34 9.46,29.85 7.06,29.85 v6.66,29.45 | v24.08,32.93 v24.08,30.24
  Bottom 0.254: v3.61,21.97 3.61,22.23 3.74,22.35 U5.10 3.74,23.62 4.01,23.89 4.52,23.89 5.39,24.77 R4.2 5.39,28.18 v6.66,29.45 | v9.96,27.81 14.5,27.81 15.55,28.86 22.69,28.86 v24.08,30.24 | 49.36 v24.08,32.93
SDA  (via drill 0.3 pad 0.61)  (1 unrouted)
  Top 0.254: v6.41,30.35 9.67,33.62 14.83,33.62 16.06,32.39 19.62,32.39 20.16,32.93
  Bottom 0.254: U5.9 3.24,25.06 R3.2 3.91,25.73 3.91,29.13 5.14,30.35 v6.41,30.35 | 49.33 v20.27,32.93
SELECTION_PIN
  Top 0.635: U$31.5 U$31.2
  Bottom 0.152: 17.58,15.11 49.8
  Bottom 0.635: U$31.5 23.85,7.07 17.73,13.19 49.8
SW_DOUN  (via drill 0.35)
  Top 0.254: 37.4,24.79 C6.1
  Top 0.61: R9.2 37.42,24.77 37.4,24.79
  Bottom 0.254: 49.26 11.38,35.58 12.25,36.45 12.25,38.23 13.75,39.73 30.49,39.73 32.2,38.02 32.2,36.06 33.08,35.18 36.13,35.18 36.38,34.93 36.38,29.59 37.9,28.07 37.9,25.04 37.65,24.79
  Bottom 0.61: R9.2 37.6,24.79 37.65,24.79 CN2.3
  other vias: 37.58,24.77
SW_OK  (via drill 0.3 pad 0.61, 0.35, 0.35 pad 0.64)  (3 unrouted)
  Top 0.254: v28,12.83 26.84,13.99 v16.57,13.99
  Top 0.61: R7.1 39.37,27.31
  Bottom 0.254: 49.13 11.38,14.21 11.74,13.84 16.42,13.84 v16.57,13.99 | v36.81,27.29 35.34,27.29 34.35,26.29 34.35,13.42 33.76,12.83 v28,12.83
SW_UP  (via drill 0.3 pad 0.55, 0.3 pad 0.61, 0.35, 0.35 pad 0.64)  (1 unrouted)
  Top 0.254: U$3.10 20.25,34.36 20.24,34.35 19.99,34.35 18.83,33.18 v17.73,33.18 | v22.83,31.96 22.83,29.42 22.33,28.91 22.33,25.1 23.17,24.26 26.47,24.26 27.74,22.99 27.74,15.37 28.25,14.86 29.27,14.86 30.22,13.9 34.41,13.9 35.87,15.37 37.9,15.37 38.67,16.13 v38.67,17.15 | C7.2 R10.1
  Top 0.61: C7.2 v39.33,22.23
  Bottom 0.254: 49.31 v17.73,33.18 | v39.33,22.23 CN2.4 | 17.71,33.75 17.71,32.4 18.14,31.96 v22.83,31.96 | R10.1 37.33,18.48 v38.67,17.15
  other vias: 37.33,22.23
TX1  (via drill 0.35 pad 0.64)
  Top 0.254: U$3.2 15.17,35.56 15.04,35.69 13.01,35.69 12.5,35.18 v12.64,35.04
  Bottom 0.254: 49.27 v12.65,35.04 v12.64,35.04
TXD  (via drill 0.35, 0.35 pad 0.64)
  Top 0.254: 22.81,35.35 U$3.14 | U$3.14 22.79,36.07 | v39.91,17.78 39.52,18.16 34.6,18.16 34.35,18.42 34.35,33.66 33.85,34.16 30.55,34.16 v29.28,35.43 | U$3.14 22.79,36.58 23.43,37.21 v23.93,37.21 | v22.92,33.13 22.79,33.25 U$3.14
  Bottom 0.254: v39.91,17.78 39.89,17.76 39.89,17.23 38.56,15.9 38.56,12.17 38.85,11.88 U$2.4 | v23.93,37.21 24.19,37.47 28.25,37.47 29.27,36.45 29.27,35.69 29.28,35.68 v29.28,35.43 | v22.92,33.13 22.81,33.24 49.35
VSYS  (1 unrouted)
  Top 0.152: 25.71,36.2 25.71,35.69 25.46,35.43 | 25.2,35.49 25.2,36.2
  Top 0.254: D1.A 28.49,37.43 | 25.2,36.2 25.2,35.69 25.2,35.49 U$3.18
  Top 0.61: D1.A 29,37.43 28.78,37.21 25.97,37.21 25.46,36.7 25.46,35.94 25.2,35.69

### Text on the board
tNames: PH_V_12-23
bNames: PH_V_12-23